# Altium schematic sheet Power-Sheet.SchDoc
size A4; SheetNumber: 2; SheetTotal: 10
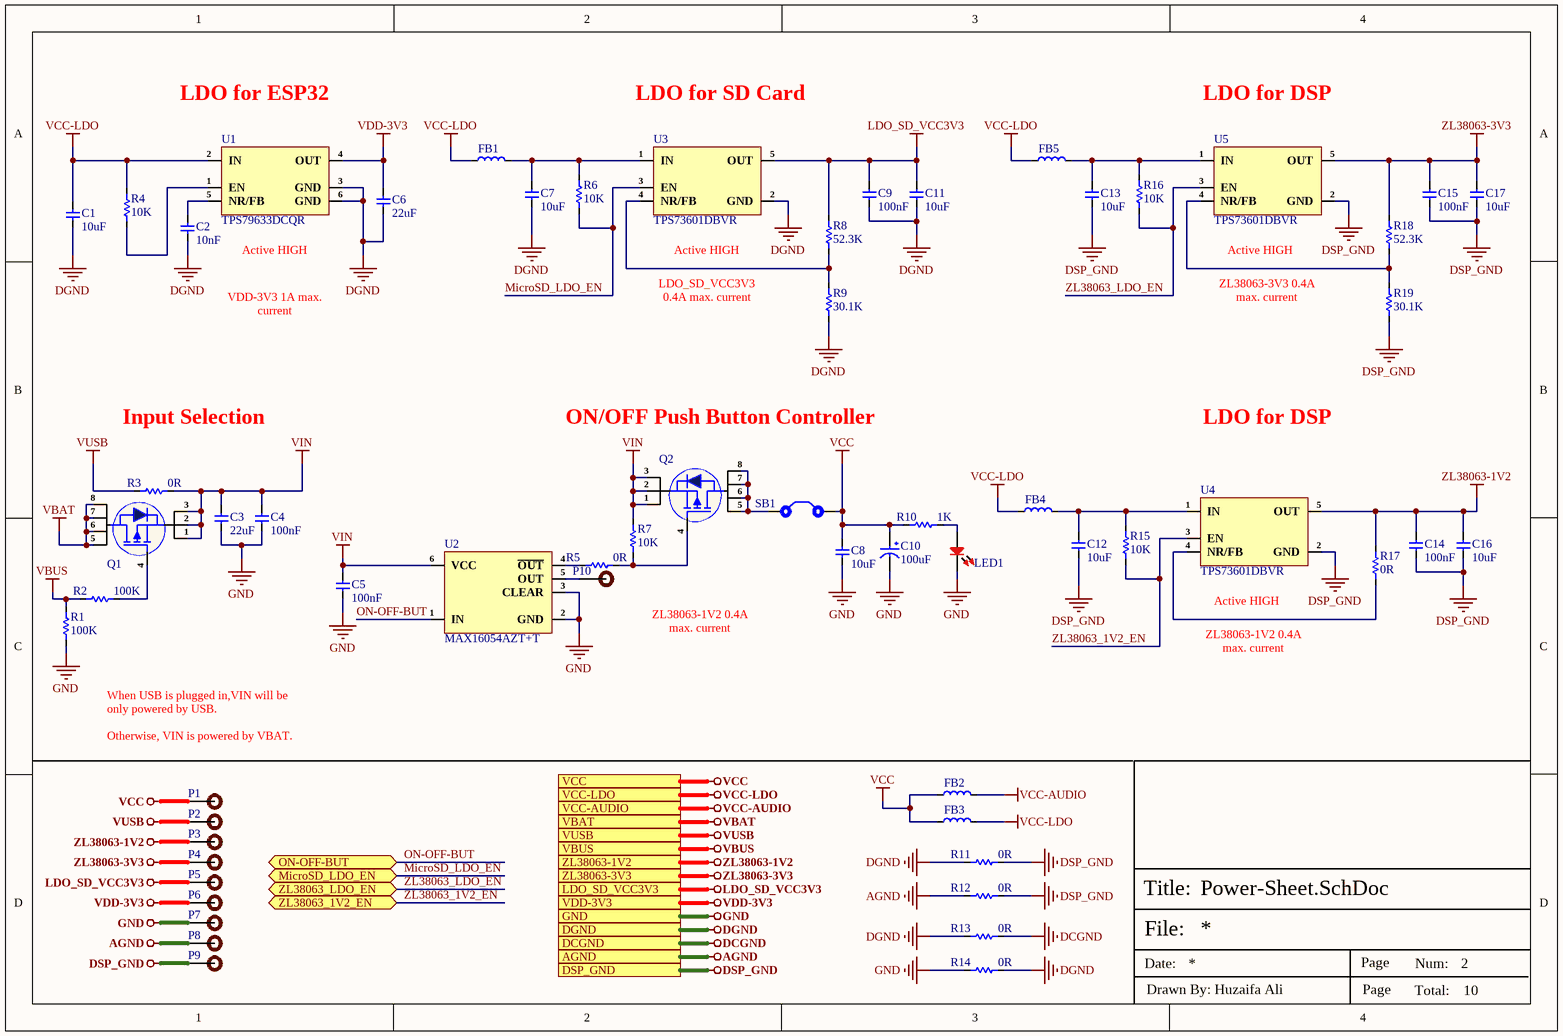
[diagram p0: Power-Sheet.SchDoc]

## Parts
C1  10uF  [Cap-0603]
C2  10nF  [Cap-0603]
C3  22uF  [Cap-0805]
C4  100nF  [Cap-0402]
C5  100nF  [Cap-0402]
C6  22uF  [Cap-0603]
C7  10uF  [Cap-0603]
C8  10uF  [Cap-0603]
C9  100nF  [Cap-0402]
C10  100uF  [Case-E]
C11  10uF  [Cap-0603]
C12  10uF  [Cap-0603]
C13  10uF  [Cap-0603]
C14  100nF  [Cap-0402]
C15  100nF  [Cap-0402]
C16  10uF  [Cap-0603]
C17  10uF  [Cap-0603]
FB1  BLM18SG121TZ1D  [IND-0603 (1608 Metric)]  (value not drawn)
FB2  BLM31KN121SZ1L  [IND-1206]  (value not drawn)
FB3  BLM18SG121TZ1D  [IND-0603 (1608 Metric)]  (value not drawn)
FB4  BLM18SG121TZ1D  [IND-0603 (1608 Metric)]  (value not drawn)
FB5  BLM18SG121TZ1D  [IND-0603 (1608 Metric)]  (value not drawn)
LED1  RED  [LED-0603]  (value not drawn)
P1  TEST POINT  [Test-point]  (value not drawn)
P2  TEST POINT  [Test-point]  (value not drawn)
P3  TEST POINT  [Test-point]  (value not drawn)
P4  TEST POINT  [Test-point]  (value not drawn)
P5  TEST POINT  [Test-point]  (value not drawn)
P6  TEST POINT  [Test-point]  (value not drawn)
P7  TEST POINT  [Test-point]  (value not drawn)
P8  TEST POINT  [Test-point]  (value not drawn)
P9  TEST POINT  [Test-point]  (value not drawn)
P10  TEST POINT  [Test-point]  (value not drawn)
Q1  IRF7410TRPBF  [SOP-8]  (value not drawn)
Q2  IRF7410TRPBF  [SOP-8]  (value not drawn)
R1  100K  [Res-0402]
R2  100K  [Res-0402]
R3  0R  [RES-2512]
R4  10K  [Res-0402]
R5  0R  [Res-0402]
R6  10K  [Res-0402]
R7  10K  [Res-0402]
R8  52.3K  [Res-0402]
R9  30.1K  [Res-0402]
R10  1K  [Res-0402]
R11  0R  [Res-0805]
R12  0R  [Res-0805]
R13  0R  [Res-0805]
R14  0R  [Res-0805]
R15  10K  [Res-0402]
R16  10K  [Res-0402]
R17  0R  [Res-0402]
R18  52.3K  [Res-0402]
R19  30.1K  [Res-0402]
SB1  Solder Bridge 0402  [Solder Bridge 0402]  (value not drawn)
U1  TPS79633DCQR  [SOT-223-6_]
U2  MAX16054AZT+T  [TSOT-23-6]
U3  TPS73601DBVR  [SOT-23-5]
U4  TPS73601DBVR  [SOT-23-5]
U5  TPS73601DBVR  [SOT-23-5]

## Ports
AGND (see Top-Sheet[1B]), DCGND (see Top-Sheet[1B]), DGND (see Top-Sheet[1A]), DSP_GND (see Top-Sheet[1B]), GND (see Top-Sheet[1A]), LDO_SD_VCC3V3 (see Top-Sheet[1B]), MicroSD_LDO_EN (bidir, see Top-Sheet[1B]), ON-OFF-BUT (bidir, see Top-Sheet[1B]), VBAT (see Top-Sheet[1A]), VBUS (see Top-Sheet[1A]), VCC (see Top-Sheet[1B]), VCC-AUDIO (see Top-Sheet[1A]), VCC-LDO (see Top-Sheet[1A]), VDD-3V3 (see Top-Sheet[1B]), VUSB (see Top-Sheet[1A]), ZL38063-1V2 (see Top-Sheet[1B]), ZL38063-3V3 (see Top-Sheet[1B]), ZL38063_1V2_EN (bidir, see Top-Sheet[1B]), ZL38063_LDO_EN (bidir, see Top-Sheet[1B])

## Nets
AGND: P8.1 R12.1 ; port AGND
DCGND: R13.2 ; port DCGND
DGND: C1.1 C2.1 C6.1 C7.1 C9.1 C11.1 R9.1 R11.1 R13.1 R14.2 U1.3(GND) U1.6(GND) U3.2(GND) ; port DGND
DSP_GND: C12.1 C13.1 C14.1 C15.1 C16.1 C17.1 P9.1 R11.2 R12.2 R19.1 U4.2(GND) U5.2(GND) ; port DSP_GND
GND: C3.1 C4.1 C5.1 C8.1 C10.2 LED1.2 P7.1 R1.1 R14.1 U2.2(GND) U2.3(CLEAR) ; port GND
LDO_SD_VCC3V3: C9.2 C11.2 P5.1 R8.2 U3.5(OUT) ; port LDO_SD_VCC3V3
VBAT: Q1.5(D) Q1.6(D) Q1.7(D) Q1.8(D) ; port VBAT
VBUS: R1.2 R2.1 ; port VBUS
VCC: C8.2 C10.1 FB2.1 FB3.1 P1.1 R10.2 SB1.2 ; port VCC
VCC-AUDIO: FB2.2 ; port VCC-AUDIO
VCC-LDO: C1.2 FB1.1 FB3.2 FB4.1 FB5.1 R4.2 U1.2(IN) ; port VCC-LDO
VDD-3V3: C6.2 P6.1 U1.4(OUT) ; port VDD-3V3
VIN: C3.2 C4.2 C5.2 Q1.1(S) Q1.2(S) Q1.3(S) Q2.1(S) Q2.2(S) Q2.3(S) R3.2 R7.2 U2.6(VCC)
VUSB: P2.1 R3.1 ; port VUSB
ZL38063-1V2: C14.2 C16.2 P3.1 R17.2 U4.5(OUT) ; port ZL38063-1V2
ZL38063-3V3: C15.2 C17.2 P4.1 R18.2 U5.5(OUT) ; port ZL38063-3V3
MicroSD_LDO_EN: R6.1 U3.3(EN) ; port MicroSD_LDO_EN
ON-OFF-BUT: U2.1(IN) ; port ON-OFF-BUT
ZL38063_1V2_EN: R15.1 U4.3(EN) ; port ZL38063_1V2_EN
ZL38063_LDO_EN: R16.1 U5.3(EN) ; port ZL38063_LDO_EN
NetC2_2: C2.2 U1.5(NR/FB)
NetC7_2: C7.2 FB1.2 R6.2 U3.1(IN)
NetC12_2: C12.2 FB4.2 R15.2 U4.1(IN)
NetC13_2: C13.2 FB5.2 R16.2 U5.1(IN)
NetLED1_1: LED1.1 R10.1
NetP10_1: P10.1 U2.5(OUT)
NetQ1_4: Q1.4(G) R2.2
NetQ2_4: Q2.4(G) R5.2 R7.1
NetQ2_5: Q2.5(D) Q2.6(D) Q2.7(D) Q2.8(D) SB1.1
NetR4_1: R4.1 U1.1(EN)
NetR5_1: R5.1 U2.4(~{OUT})
NetR8_1: R8.1 R9.2 U3.4(NR/FB)
NetR17_1: R17.1 U4.4(NR/FB)
NetR18_1: R18.1 R19.2 U5.4(NR/FB)

## Notes on the sheet
- LDO for ESP32
- LDO for SD Card
- LDO for DSP
- Active HIGH
- (near U3) Active HIGH
- (near U5) Active HIGH
- VDD-3V3 1A max. current
- LDO_SD_VCC3V3 0.4A max. current
- ZL38063-3V3 0.4A max. current
- Input Selection
- (near Q2) ON/OFF Push Button Controller
- ZL38063-1V2 0.4A max. current
- (near U4) Active HIGH
- When USB is plugged in,VIN will be only powered by USB.
  Otherwise, VIN is powered by VBAT.
- File:
- Title:
- Date:
- Page
- Num:
- Total:
- Drawn By: Huzaifa Ali

## Library data of the parts
C1 C7 C8 C11-C13 C16 C17 = CC0603KRX5R7BB106: CAP CER 10UF 16V X5R 0603; Manufacturer: Yageo; Tolerance: 10%; Item Type: Capacitor; Supplier 1: Digi-Key; Manufacturer Part Number: CC0603KRX5R7BB106; RoHS: Yes; Category: Ceramic Capacitors; Stock 1: 240725; Pricing 1: 1=0.68000, 10=0.48000, 50=0.36300, 100=0.31610, 500=0.23416, 1000=0.19903 (USD); Mount: Surface Mount; Case/Package: 0603; Case Code (Imperial): 0603; Case Code (Metric): 1608; Min Operating Temperature: -55°C; Max Operating Temperature: 85°C; Packaging: Cut Tape; Capacitance: 10uF; Voltage Rating: 16V; RoHS Compliant: Yes; ComponentLink1URL: http://www.yageo.com/documents/recent/UPY-GPHC_X5R_4V-to-50V_25.pdf?src-supplier=Digi-Key; ComponentLink1Description: http://www.yageo.com/documents/recent/UPY-GPHC_X5R_4V-to-50V_25.pdf?src-supplier=Digi-Key; Supplier Part Number 1: 311-3486-1-ND; LCSC Part Number: C2936601
C2 = CC0603JRNPO9BN103: CAP CER 10000PF 50V C0G/NPO 0603; Manufacturer: Yageo; Tolerance: 5%; Item Type: Capacitor; Supplier 1: Arrow Electronics; Manufacturer Part Number: CC0603JRNPO9BN103; RoHS: Yes; Category: Ceramic Capacitors; Stock 1: 5425; Pricing 1: 1=0.42340, 10=0.29770, 25=0.25590, 100=0.19550, 250=0.19360, 500=0.14320, 1000=0.12060, 3000=0.11930 (USD); Mount: Surface Mount; Case/Package: 0603; Min Operating Temperature: -55°C; Max Operating Temperature: 125°C; Packaging: Tape and Reel; Capacitance: 10nF; Voltage Rating: 50V; Length: 0.063inch; Width: 0.031inch; Thickness: 0.035inch; RoHS Compliant: Yes; ComponentLink1URL: http://www.yageo.com/documents/recent/UPY-GP_NP0_16V-to-50V_16.pdf?src-supplier=Digi-Key; ComponentLink1Description: http://www.yageo.com/documents/recent/UPY-GP_NP0_16V-to-50V_16.pdf?src-supplier=Digi-Key; ComponentLink2URL: http://www.yageo.com/exep/pages/download/literatures/ProductSelectionGuide%202014_Final_2.pdf?src-supplier=Digi-Key; ComponentLink2Description: http://www.yageo.com/exep/pages/download/literatures/ProductSelectionGuide%202014_Final_2.pdf?src-supplier=Digi-Key; Supplier Part Number 1: CC0603JRNPO9BN103; LCSC Part Number: C389113
C3 = CL21A226MOCLRNC: CAP CER 22UF 16V X5R 0805; Manufacturer: Samsung; Tolerance: 20%; Item Type: Capacitor; Supplier 1: Arrow Electronics; Manufacturer Part Number: CL21A226MOCLRNC; RoHS: Yes; Category: Ceramic Capacitors; Stock 1: 10030; Pricing 1: 1=0.29150, 10=0.21440, 25=0.20710, 100=0.12030, 250=0.11910, 500=0.11790, 1000=0.09220, 3000=0.07810, 6000=0.07720, 15000=0.06700 (USD); Mounting Technology: Surface Mount; Case/Package: 0805; Case Code (Metric): 2012; Case Code (Imperial): 0805; Min Operating Temperature: -55°C; Max Operating Temperature: 85°C; Packaging: Tape and Reel; Value: 22uF; Voltage Rating: 16V; Length: 0.079inch; Width: 0.049inch; Thickness: 0.037inch; RoHS Compliant: Yes; ComponentLink1URL: http://www.samsungsem.com/kr/support/product-search/mlcc/CL21A226MOCLRNC.jsp?src-supplier=Digi-Key; ComponentLink1Description: http://www.samsungsem.com/kr/support/product-search/mlcc/CL21A226MOCLRNC.jsp?src-supplier=Digi-Key; Supplier Part Number 1: CL21A226MOCLRNC; LCSC Part Number: C398815
C4 C5 C9 C14 C15 = CC0402KRX5R7BB104: CAP CER 0.1UF 16V X5R 0402; Manufacturer: Yageo; Tolerance: 10%; Supplier 1: Mouser; Manufacturer Part Number: CC0402KRX5R7BB104; RoHS: Yes; Category: Ceramic Capacitors; Stock 1: 936792; Pricing 1: 1=0.10000, 10=0.02300, 50=0.02300, 100=0.01100, 1000=0.00600, 10000=0.00400 (USD); Mount: Surface Mount; Case/Package: 0402; Number of Pins: 2; Case Code (Metric): 1005; Case Code (Imperial): 0402; Min Operating Temperature: -55°C; Max Operating Temperature: 85°C; Capacitance: 100nF; Dielectric: X5R; Packaging: Tape and Reel; Voltage Rating: 16V; Package Quantity: 1; Voltage Rating (DC): 16V; Termination: SMD/SMT; Resistor Type: Ceramic; Series: CC; Construction: Flat; Length: 1mm; Width: 0.02inch; Height: 0.5mm; Thickness: 0.022inch; Depth: 0.5mm; Radiation Hardening: No; REACH SVHC: Unknown; Lead Free: Lead Free; Halogen Free: Halogen Free; RoHS Compliant: Yes; ComponentLink1URL: https://datasheet.ciiva.com/155/mlccorderingcode-155879.pdf?src-supplier=Digi-Key; ComponentLink1Description: https://datasheet.ciiva.com/155/mlccorderingcode-155879.pdf?src-supplier=Digi-Key; ComponentLink2URL: https://datasheet.ciiva.com/155/mlccorderingcode-155878.pdf?src-supplier=Digi-Key; ComponentLink2Description: https://datasheet.ciiva.com/155/mlccorderingcode-155878.pdf?src-supplier=Digi-Key; ComponentLink3URL: https://datasheet.ciiva.com/155/mlccorderingcode-155880.pdf?src-supplier=Digi-Key; ComponentLink3Description: https://datasheet.ciiva.com/155/mlccorderingcode-155880.pdf?src-supplier=Digi-Key; ComponentLink4URL: https://datasheet.ciiva.com/11464/upy-gphc-x5r-4v-to-50v-12-11464869.pdf?src-supplier=Avnet; ComponentLink4Description: https://datasheet.ciiva.com/11464/upy-gphc-x5r-4v-to-50v-12-11464869.pdf?src-supplier=Avnet; Supplier Part Number 1: 603-CC402KRX5R7BB104; LCSC Part Number: C106204
C6 = CC0603MRX5R6BB226: CAP CER 22UF 10V X5R 0603; Manufacturer: Yageo; Tolerance: 20%; Item Type: Capacitor; Supplier 1: Digi-Key; Manufacturer Part Number: CC0603MRX5R6BB226; RoHS: Yes; Category: Ceramic Capacitors; Stock 1: 19628; Pricing 1: 1=0.68000, 10=0.48000, 50=0.36300, 100=0.31610, 500=0.23416, 1000=0.19903 (USD); Mount: Surface Mount; Case/Package: 0603; Case Code (Metric): 1608; Case Code (Imperial): 0603; Weight: 7.1E-05oz; Min Operating Temperature: -55°C; Max Operating Temperature: 85°C; Packaging: Tape and Reel; Capacitance: 22uF; Voltage Rating: 10V; Dielectric: X5R; Termination: SMD/SMT; Voltage Rating (DC): 10V; Package Quantity: 4000; Length: 0.063inch; Width: 0.8mm; Height: 0.8mm; Thickness: 0.035inch; Lead Free: Lead Free; Halogen Free: Halogen Free; RoHS Compliant: Yes; ComponentLink1URL: http://www.mouser.com/ds/2/447/Yageo_UPY-GP_NP0_16V-to-50V_9-358835.pdf?src-supplier=Mouser; ComponentLink1Description: http://www.mouser.com/ds/2/447/Yageo_UPY-GP_NP0_16V-to-50V_9-358835.pdf?src-supplier=Mouser; ComponentLink2URL: http://www.yageo.com/documents/recent/UPY-GPHC_X5R_4V-to-50V_25.pdf?src-supplier=Digi-Key; ComponentLink2Description: http://www.yageo.com/documents/recent/UPY-GPHC_X5R_4V-to-50V_25.pdf?src-supplier=Digi-Key; Supplier Part Number 1: 311-1819-1-ND; LCSC Part Number: C109447
C10 = TAJE107M025RNJ: CAP TANT 100UF 20% 25V 2917; Manufacturer: Kyocera AVX; ESR (Equivalent Series Resistance): 300mR; Leakage Current: 25uA; Polarity: Polar; Dissipation Factor: 10%; Supplier 1: Mouser; Manufacturer Part Number: TAJE107M025RNJ; RoHS: Yes; Category: Tantalum Capacitors; Stock 1: 109; Pricing 1: 1=2.81000, 10=2.81000, 50=2.81000, 100=2.19000, 1000=1.76000, 10000=1.76000 (USD); Mount: Surface Mount; Case/Package: 2917; Number of Pins: 2; Case Code (Imperial): 2917; Case Code (Metric): 7343; Min Operating Temperature: -55°C; Max Operating Temperature: 125°C; Capacitance: 100uF; Tolerance: 20%; Packaging: Tape and Reel; Voltage Rating: 25V; Voltage Rating (DC): 25V; Features: General Purpose; Package Quantity: 1; Termination: SMD/SMT; Series: TAJ; Construction: Flat; Length: 7.3mm; Width: 4.3mm; Height: 4.3mm; Depth: 4.3mm; Height - Seated (Max): 0.169inch; Radiation Hardening: No; Lead Free: Lead Free; RoHS Compliant: Yes; REACH SVHC: No SVHC; ComponentLink1URL: https://datasheet.ciiva.com/26787/taje107m025rnj-26787048.pdf?src-supplier=IIIC; ComponentLink1Description: https://datasheet.ciiva.com/26787/taje107m025rnj-26787048.pdf?src-supplier=IIIC; ComponentLink2URL: https://datasheet.ciiva.com/265/taj-265541.pdf?src-supplier=Digi-Key; ComponentLink2Description: https://datasheet.ciiva.com/265/taj-265541.pdf?src-supplier=Digi-Key; ComponentLink3URL: https://datasheet.ciiva.com/265/taj-265542.pdf?src-supplier=Digi-Key; ComponentLink3Description: https://datasheet.ciiva.com/265/taj-265542.pdf?src-supplier=Digi-Key; ComponentLink4URL: https://datasheet.ciiva.com/265/taj-265540.pdf?src-supplier=Digi-Key; ComponentLink4Description: https://datasheet.ciiva.com/265/taj-265540.pdf?src-supplier=Digi-Key; ComponentLink5URL: https://datasheet.ciiva.com/28609/1719052-28609254.pdf?src-supplier=Element14; ComponentLink5Description: https://datasheet.ciiva.com/28609/1719052-28609254.pdf?src-supplier=Element14; ComponentLink6URL: https://datasheet.ciiva.com/11230/taj-11230456.pdf?src-supplier=Avnet; ComponentLink6Description: https://datasheet.ciiva.com/11230/taj-11230456.pdf?src-supplier=Avnet; ComponentLink7URL: https://datasheet.ciiva.com/17339/taj-17339677.pdf?src-supplier=Avnet+Europe; ComponentLink7Description: https://datasheet.ciiva.com/17339/taj-17339677.pdf?src-supplier=Avnet+Europe; ComponentLink8URL: https://datasheet.ciiva.com/22667/1719052-22667581.pdf?src-supplier=Element14; ComponentLink8Description: https://datasheet.ciiva.com/22667/1719052-22667581.pdf?src-supplier=Element14; Supplier Part Number 1: 581-TAJE107M025RNJ; LCSC Part Number: C7230
FB1 FB3-FB5 = BLM18SG121TZ1D: FERRITE BEAD 120 OHM 0603 1LN; Manufacturer: Murata; Core Material: 228ConductorMaterial; Value: 25mR; RMS Current (Irms): 3A; Test Frequency: 100MHz; Tolerance: 25%; Supplier: Rs; Supplier Part Number: 2234927P; Manufacturer Part Number: BLM18SG121TZ1D; RoHS: Yes; Category: Ferrite Beads and Chips; Stock: 19700; Pricing: 500=0.033, 1000=0.028, 2000=0.026, 5000=0.024 (GBP); ESR: 25mR; Height: 650um; ComponentLink1URL: https://datasheet.octopart.com/BLM18SG121TZ1D-Murata-datasheet-101965366.pdf?src-supplier=Future+Electronics; ComponentLink1Description: https://datasheet.octopart.com/BLM18SG121TZ1D-Murata-datasheet-101965366.pdf?src-supplier=Future+Electronics; ComponentLink2URL: https://www.murata.com/en-us/products/productdata/8796750610462/QNFA9122.pdf?src-supplier=Digi-Key; ComponentLink2Description: https://www.murata.com/en-us/products/productdata/8796750610462/QNFA9122.pdf?src-supplier=Digi-Key; LCSC Part Number: C710390; Item Type: Ferrite Bead
FB2 = BLM31KN121SZ1L: FERRITE BEAD 120 OHM 1206 1LN; Manufacturer: Murata; Core Material: 228ConductorMaterial; Number of Lines: 1; Max Current Rating: 6A; Value: 9mR; Test Frequency: 100MHz; Tolerance: 25%; Supplier: Arrow Electronics; Supplier Part Number: BLM31KN121SZ1L; Manufacturer Part Number: BLM31KN121SZ1L; RoHS: Yes; Category: Ferrite Beads and Chips; Stock: 1640; Pricing: 1=0.2889, 10=0.1979, 25=0.1782, 100=0.1604, 250=0.1402, 500=0.1315, 1000=0.108, 3000=0.1008, 6000=0.0945 (USD); Mounting Technology: Surface Mount; Case/Package: 1206; Case Code (Imperial): 1206; Case Code (Metric): 3216; Min Operating Temperature: -55°C; Max Operating Temperature: 125°C; Packaging: Cut Tape; Series: BLM; RMS Current (Irms): 6A; ESR: 9mR; Height: 1.8mm; Ratings: AEC-Q200; RoHS Compliant: Yes; ComponentLink1URL: https://www.murata.com/en-global/products/productdata/8796751200286/QNFA9115.pdf?src-supplier=Digi-Key; ComponentLink1Description: https://www.murata.com/en-global/products/productdata/8796751200286/QNFA9115.pdf?src-supplier=Digi-Key; LCSC Part Number: C710516; Item Type: Ferrite Bead
LED1 = NCD0603R3: RED LED 0603 Light Emitting Diodes; Manufacturer: Foshan NationStar Optoelectronics; Manufacturer Part Number: NCD0603R3; Package: 0603; Item Type: LED; LCSC Part Number: C3151730; ComponentLink1Description: LCSC; ComponentLink1URL: https://www.lcsc.com/product-detail/Light-Emitting-Diodes-LED_Foshan-NationStar-Optoelectronics-NCD0603R3_C3151730.html
P1-P10 = TEST POINT: Test Point ON; Item Type: TEST POINT
Q1 Q2 = IRF7410TRPBF: MOSFET P-CH 12V 16A 8SO; Manufacturer: Infineon; Supplier: Mouser; Supplier Part Number: 942-IRF7410TRPBF; Manufacturer Part Number: IRF7410TRPBF; RoHS: Yes; Category: MOSFETs; Stock: 296; Pricing: 1=1.13, 10=0.922, 50=0.922, 100=0.716, 1000=0.487, 10000=0.437 (USD); ComponentLink1URL: http://datasheet.octopart.com/IRF7410TRPBF-Infineon-datasheet-8080302.pdf?src-supplier=TME; ComponentLink1Description: http://datasheet.octopart.com/IRF7410TRPBF-Infineon-datasheet-8080302.pdf?src-supplier=TME; LCSC Part Number: C148144; Item Type: MOSFET
R1 R2 = RC0402FR-07100KL: RES 100K OHM 1% 1/16W 0402; Manufacturer: Yageo; Resistance: 100kR; Temperature Coefficient: 100ppm/°C; Power Rating: 63mW; Voltage Rating: 50V; Item Type: Resistor; Supplier 1: Mouser; Manufacturer Part Number: RC0402FR-07100KL; RoHS: Yes; Category: Chip SMD Resistors; Stock 1: 7759549; Pricing 1: 1=0.10000, 10=0.01200, 50=0.01200, 100=0.00500, 1000=0.00300, 2500=0.00200, 10000=0.00100 (USD); Case/Package: 0402; Case Code (Metric): 1005; Case Code (Imperial): 0402; Min Operating Temperature: -55°C; Max Operating Temperature: 155°C; Resistor Type: Thick Film; Tolerance: 1%; Packaging: Tape and Reel; Package Quantity: 1; Number of Terminations: 2; Termination: SMD/SMT; Max Power Dissipation: 63mW; Working Voltage: 50V; Features: Moisture Resistant; Series: RC; Resistance Tolerance: 1%; Construction: Rectangular; Technology: THICK FILM; Length: 0.039inch; Width: 0.02inch; Height: 0.016inch; Depth: 0.5mm; REACH SVHC: No SVHC; Lead Free: Lead Free; RoHS Compliant: Yes; Military Standard: Not; ComponentLink1URL: https://datasheet.ciiva.com/11819/0900766b80c66297-11819452.pdf?src-supplier=RSComponents; ComponentLink1Description: https://datasheet.ciiva.com/11819/0900766b80c66297-11819452.pdf?src-supplier=RSComponents; ComponentLink2URL: https://datasheet.ciiva.com/22747/1018594-22747509.pdf?src-supplier=Element14; ComponentLink2Description: https://datasheet.ciiva.com/22747/1018594-22747509.pdf?src-supplier=Element14; ComponentLink3URL: https://datasheet.ciiva.com/2453/pyu-r-int-thick-7-2453362.pdf?src-supplier=Digi-Key; ComponentLink3Description: https://datasheet.ciiva.com/2453/pyu-r-int-thick-7-2453362.pdf?src-supplier=Digi-Key; ComponentLink4URL: https://datasheet.ciiva.com/2453/pyu-r-int-thick-7-2453363.pdf?src-supplier=Digi-Key; ComponentLink4Description: https://datasheet.ciiva.com/2453/pyu-r-int-thick-7-2453363.pdf?src-supplier=Digi-Key; ComponentLink5URL: https://datasheet.ciiva.com/2453/pyu-r-int-thick-7-2453361.pdf?src-supplier=Digi-Key; ComponentLink5Description: https://datasheet.ciiva.com/2453/pyu-r-int-thick-7-2453361.pdf?src-supplier=Digi-Key; ComponentLink6URL: https://datasheet.ciiva.com/12667/pyu-rc0402-51-rohs-l-6-r-12667930.pdf?src-supplier=Mouser; ComponentLink6Description: https://datasheet.ciiva.com/12667/pyu-rc0402-51-rohs-l-6-r-12667930.pdf?src-supplier=Mouser; ComponentLink7URL: https://datasheet.ciiva.com/15189/getdatasheetpartid-323696-15189334.pdf?src-supplier=Verical; ComponentLink7Description: https://datasheet.ciiva.com/15189/getdatasheetpartid-323696-15189334.pdf?src-supplier=Verical; Supplier Part Number 1: 603-RC0402FR-07100KL; LCSC Part Number: C60491
R3 = FRP2512F0000TS: 2W Thick Film Resistors ±200ppm/℃ ±1% 0Ω 2512 Chip Resistor - Surface Mount ROHS; Manufacturer: FOJAN; Manufacturer Part Number: FRP2512F0000TS; Package: 2512; LCSC Part Number: C5204052; Item Type: Resistor; ComponentLink1Description: LCSC; ComponentLink1URL: https://www.lcsc.com/product-detail/Chip-Resistor-Surface-Mount_FOJAN-FRP2512F0000TS_C5204052.html
R4 R6 R7 R15 R16 = RC0402FR-0710KL: RES 10K OHM 1% 1/16W 0402; Manufacturer: Yageo; Resistance: 10kR; Voltage Rating (DC): 50V; Temperature Coefficient: 100ppm/°C; Power Rating: 62.5mW; Max Power Dissipation: 63mW; Item Type: Resistor; Supplier 1: Mouser; Manufacturer Part Number: RC0402FR-0710KL; RoHS: Yes; Category: Chip SMD Resistors; Stock 1: 18648329; Pricing 1: 1=0.10000, 10=0.01400, 50=0.01400, 100=0.00500, 1000=0.00300, 10000=0.00200 (USD); Case/Package: 0402; Number of Pins: 2; Case Code (Imperial): 0402; Case Code (Metric): 1005; Min Operating Temperature: -55°C; Max Operating Temperature: 155°C; Resistor Type: Thick Film; Tolerance: 1%; Packaging: Tape and Reel; Voltage Rating: 50V; Termination: SMD/SMT; Working Voltage: 50V; Number of Terminations: 2; Features: Moisture Resistant; Series: RC; Resistance Tolerance: 1%; Construction: Rectangular; Length: 1mm; Width: 0.5mm; Height: 0.32mm; Depth: 0.5mm; Lead Pitch: 0.2mm; REACH SVHC: No SVHC; Lead Free: Lead Free; RoHS Compliant: Yes; Military Standard: Not; ComponentLink1URL: https://datasheet.ciiva.com/7660/38568-7660787.pdf?src-supplier=Element14; ComponentLink1Description: https://datasheet.ciiva.com/7660/38568-7660787.pdf?src-supplier=Element14; ComponentLink2URL: https://datasheet.ciiva.com/7849/1686128-7849814.pdf?src-supplier=Element14; ComponentLink2Description: https://datasheet.ciiva.com/7849/1686128-7849814.pdf?src-supplier=Element14; ComponentLink3URL: https://datasheet.ciiva.com/7983/1018594-7983486.pdf?src-supplier=Element14; ComponentLink3Description: https://datasheet.ciiva.com/7983/1018594-7983486.pdf?src-supplier=Element14; ComponentLink4URL: https://datasheet.ciiva.com/22747/1018594-22747512.pdf?src-supplier=Element14; ComponentLink4Description: https://datasheet.ciiva.com/22747/1018594-22747512.pdf?src-supplier=Element14; ComponentLink5URL: https://datasheet.ciiva.com/12667/pyu-rc0402-51-rohs-l-6-r-12667067.pdf?src-supplier=Mouser; ComponentLink5Description: https://datasheet.ciiva.com/12667/pyu-rc0402-51-rohs-l-6-r-12667067.pdf?src-supplier=Mouser; ComponentLink6URL: https://datasheet.ciiva.com/7849/1784430-7849813.pdf?src-supplier=Element14; ComponentLink6Description: https://datasheet.ciiva.com/7849/1784430-7849813.pdf?src-supplier=Element14; ComponentLink7URL: https://datasheet.ciiva.com/7849/1784430-7849815.pdf?src-supplier=Element14; ComponentLink7Description: https://datasheet.ciiva.com/7849/1784430-7849815.pdf?src-supplier=Element14; Supplier Part Number 1: 603-RC0402FR-0710KL; LCSC Part Number: C60490
R5 R17 = RC0402FR-070RL: RES 0 OHM JUMPER 1/16W 0402; Manufacturer: Yageo; Tolerance: 1%; Power Rating: 62.5mW; Voltage Rating: 50V; Temperature Coefficient: 200ppm/°C; Max Power Dissipation: 63mW; Supplier 1: Mouser; Manufacturer Part Number: RC0402FR-070RL; RoHS: Yes; Category: Chip SMD Resistors; Stock 1: 8556842; Pricing 1: 1=0.10000, 10=0.01400, 50=0.01400, 100=0.00600, 1000=0.00300, 5000=0.00200, 10000=0.00100 (USD); Mount: Surface Mount; Case/Package: 0402; Contact Plating: Tin,Matte; Case Code (Imperial): 0402; Case Code (Metric): 1005; Size Code: 0402; Min Operating Temperature: -55°C; Max Operating Temperature: 155°C; Resistance: 0R; Resistor Type: Thick Film; Packaging: Tape and Reel; Termination: SMD/SMT; Features: Moisture Resistant; Series: RC; Number of Terminations: 2; Length: 1mm; Width: 0.5mm; Height: 0.35mm; Radiation Hardening: No; Lead Free: Lead Free; RoHS Compliant: Yes; ComponentLink1URL: https://datasheet.ciiva.com/8896/pyu-rc0402-51-rohs-l-6-8896149.pdf?src-supplier=Avnet; ComponentLink1Description: https://datasheet.ciiva.com/8896/pyu-rc0402-51-rohs-l-6-8896149.pdf?src-supplier=Avnet; ComponentLink2URL: https://datasheet.ciiva.com/16790/pyu-rc0402-51-rohs-l-6-r-16790444.pdf?src-supplier=Future+Electronics; ComponentLink2Description: https://datasheet.ciiva.com/16790/pyu-rc0402-51-rohs-l-6-r-16790444.pdf?src-supplier=Future+Electronics; Supplier Part Number 1: 603-RC0402FR-070RL; LCSC Part Number: C106231
R8 R18 = RT0402BRD0752K3L: RES SMD 52.3KOHM 0.1% 1/16W 0402; Manufacturer: Yageo; Item Type: Resistor; Supplier: Future Electronics; Supplier Part Number: 8123886; Manufacturer Part Number: RT0402BRD0752K3L; RoHS: Yes; Category: Chip SMD Resistors; Stock: 30000; Pricing: 10000=0.0218, 20000=0.0213, 30000=0.021, 50000=0.0206, 100000=0.0199 (USD); ComponentLink1URL: https://datasheet.ciiva.com/2582/pyu-rt-1-to-0-05-rohs-l-4-2582419.pdf?src-supplier=Digi-Key; ComponentLink1Description: https://datasheet.ciiva.com/2582/pyu-rt-1-to-0-05-rohs-l-4-2582419.pdf?src-supplier=Digi-Key; ComponentLink2URL: https://datasheet.ciiva.com/12798/pyu-rt-1-to-0-05-rohs-l-4-12798955.pdf?src-supplier=Mouser; ComponentLink2Description: https://datasheet.ciiva.com/12798/pyu-rt-1-to-0-05-rohs-l-4-12798955.pdf?src-supplier=Mouser; LCSC Part Number: C852832
R9 R19 = RT0402BRD0730K1L: RES SMD 30.1KOHM 0.1% 1/16W 0402; Manufacturer: Yageo; Item Type: Resistor; Supplier: Rs; Supplier Part Number: 1991324P; Manufacturer Part Number: RT0402BRD0730K1L; RoHS: Yes; Category: Chip SMD Resistors; Stock: 7420; Pricing: 100=0.138, 250=0.115, 500=0.092, 1000=0.076 (GBP); ComponentLink1URL: https://datasheet.ciiva.com/12722/pyu-rt-1-to-0-05-rohs-l-4-12722119.pdf?src-supplier=Mouser; ComponentLink1Description: https://datasheet.ciiva.com/12722/pyu-rt-1-to-0-05-rohs-l-4-12722119.pdf?src-supplier=Mouser; ComponentLink2URL: https://datasheet.ciiva.com/2582/pyu-rt-1-to-0-05-rohs-l-5-2582303.pdf?src-supplier=Digi-Key; ComponentLink2Description: https://datasheet.ciiva.com/2582/pyu-rt-1-to-0-05-rohs-l-5-2582303.pdf?src-supplier=Digi-Key; LCSC Part Number: C852714
R10 = RC0402FR-071KL: RES 1K OHM 1% 1/16W 0402; Manufacturer: Yageo; Resistance: 1kR; Temperature Coefficient: 100ppm/°C; Voltage Rating (DC): 50V; Power Rating: 62.5mW; Max Power Dissipation: 63mW; Item Type: Resistor; Supplier 1: Avnet; Manufacturer Part Number: RC0402FR-071KL; RoHS: Yes; Category: Chip SMD Resistors; Stock 1: 13030000; Pricing 1: 10000=0.00085, 20000=0.00087, 40000=0.00084, 60000=0.00083, 80000=0.00079, 100000=0.00078, 1000000=0.00076 (USD); Case/Package: 0402; Number of Pins: 2; Case Code (Imperial): 0402; Case Code (Metric): 1005; Size Code: 0402; Min Operating Temperature: -55°C; Max Operating Temperature: 155°C; Resistor Type: Thick Film; Tolerance: 1%; Packaging: Tape and Reel; Voltage Rating: 50V; Termination: SMD/SMT; Features: Moisture Resistant; Series: RC; Number of Terminations: 2; Resistance Tolerance: 1%; Construction: Rectangular; Technology: THICK FILM; Length: 1mm; Width: 0.5mm; Height: 0.32mm; Depth: 0.5mm; Reach SVHC Compliant: Yes; Lead Free: Lead Free; RoHS Compliant: Yes; Military Standard: Not; ComponentLink1URL: https://datasheet.ciiva.com/11819/0900766b80c66297-11819477.pdf?src-supplier=RSComponents; ComponentLink1Description: https://datasheet.ciiva.com/11819/0900766b80c66297-11819477.pdf?src-supplier=RSComponents; ComponentLink2URL: https://datasheet.ciiva.com/7983/1018594-7983502.pdf?src-supplier=Element14; ComponentLink2Description: https://datasheet.ciiva.com/7983/1018594-7983502.pdf?src-supplier=Element14; ComponentLink3URL: https://datasheet.ciiva.com/22747/1018594-22747513.pdf?src-supplier=Element14; ComponentLink3Description: https://datasheet.ciiva.com/22747/1018594-22747513.pdf?src-supplier=Element14; ComponentLink4URL: https://datasheet.ciiva.com/12666/pyu-rc0402-51-rohs-l-6-r-12666741.pdf?src-supplier=Mouser; ComponentLink4Description: https://datasheet.ciiva.com/12666/pyu-rc0402-51-rohs-l-6-r-12666741.pdf?src-supplier=Mouser; ComponentLink5URL: https://datasheet.ciiva.com/7849/1018594-7849869.pdf?src-supplier=Element14; ComponentLink5Description: https://datasheet.ciiva.com/7849/1018594-7849869.pdf?src-supplier=Element14; ComponentLink6URL: https://datasheet.ciiva.com/7849/1018594-7849871.pdf?src-supplier=Element14; ComponentLink6Description: https://datasheet.ciiva.com/7849/1018594-7849871.pdf?src-supplier=Element14; ComponentLink7URL: https://datasheet.ciiva.com/17063/pyu-rc0402-51-rohs-l-6-r-17063193.pdf?src-supplier=Future+Electronics; ComponentLink7Description: https://datasheet.ciiva.com/17063/pyu-rc0402-51-rohs-l-6-r-17063193.pdf?src-supplier=Future+Electronics; Supplier Part Number 1: RC0402FR-071KL; LCSC Part Number: C106235
R11-R14 = RC0805FR-070RL: RES 0 OHM JUMPER 1/8W 0805; Manufacturer: Yageo; Resistance: 0mR; Tolerance: 1%; Power Rating: 125mW; Item Type: Resistor; Supplier 1: Avnet; Manufacturer Part Number: RC0805FR-070RL; RoHS: Yes; Category: Chip SMD Resistors; Stock 1: 85000; Pricing 1: 5000=0.00281, 10000=0.00277, 20000=0.00269 (USD); Case/Package: 0805; Contact Plating: Tin,Matte; Case Code (Imperial): 0805; Case Code (Metric): 2012; Size Code: 0805; Min Operating Temperature: -55°C; Max Operating Temperature: 155°C; Resistor Type: Thick Film; Packaging: Tape and Reel; Features: Moisture Resistant; Series: RC; Max Power Dissipation: 125mW; Number of Terminations: 2; Construction: Rectangular; Length: 2mm; Depth: 1.25mm; Radiation Hardening: No; Military Standard: Not; Lead Free: Lead Free; RoHS Compliant: Yes; ComponentLink1URL: https://datasheet.ciiva.com/15189/getdatasheetpartid-348154-15189885.pdf?src-supplier=Verical; ComponentLink1Description: https://datasheet.ciiva.com/15189/getdatasheetpartid-348154-15189885.pdf?src-supplier=Verical; ComponentLink2URL: https://datasheet.ciiva.com/17042/rc0805-17042698.pdf?src-supplier=Future+Electronics; ComponentLink2Description: https://datasheet.ciiva.com/17042/rc0805-17042698.pdf?src-supplier=Future+Electronics; Supplier Part Number 1: RC0805FR-070RL; LCSC Part Number: C100045
SB1 = Solder Bridge 0402: Solder Bridge ON; Manufacturer Part Number: Solder Bridge 0402; Item Type: Solder Bridge
U1 = TPS79633DCQR: IC REG LINEAR 3.3V 1A SOT223-6; Manufacturer: Texas Instruments; Supplier: Mouser; Supplier Part Number: 595-TPS79633DCQR; Manufacturer Part Number: TPS79633DCQR; RoHS: Yes; Category: Voltage Regulators - Linear; Stock: 3089; Pricing: 1=3.24, 10=2.75, 50=2.75, 100=2.39, 1000=1.72, 10000=1.56 (USD); Length: 6.5mm; Width: 3.5mm; Thickness: 1.6mm; ComponentLink1URL: https://datasheet.ciiva.com/2045/tps79601-2045264.pdf?src-supplier=Digi-Key; ComponentLink1Description: https://datasheet.ciiva.com/2045/tps79601-2045264.pdf?src-supplier=Digi-Key; ComponentLink2URL: https://datasheet.ciiva.com/22704/1846966-22704703.pdf?src-supplier=Element14; ComponentLink2Description: https://datasheet.ciiva.com/22704/1846966-22704703.pdf?src-supplier=Element14; ComponentLink3URL: https://datasheet.ciiva.com/41462/001015136-da-01-en-ic-reg-ldo-3-3v-1-tps79633dcqr-sot-6-tid-41462982.pdf?src-supplier=Conrad; ComponentLink3Description: https://datasheet.ciiva.com/41462/001015136-da-01-en-ic-reg-ldo-3-3v-1-tps79633dcqr-sot-6-tid-41462982.pdf?src-supplier=Conrad; LCSC Part Number: C485803; Item Type: IC
U2 = MAX16054AZT+T: IC CNTRLR ON/OFF W/DEB TSOT23-6; Manufacturer: Maxim; Max Power Dissipation: 727W; Max Supply Voltage: 5.5V; Min Supply Voltage: 2.7V; Number of Voltages Monitored: 1; Undervoltage Threshold: 1.8V; Operating Supply Current: 7uA; Watchdog Timer: No; Output Type: PUSH-PULL; Supplier 1: Arrow Electronics; Manufacturer Part Number: MAX16054AZT+T; RoHS: Yes; Category: Interface ICs; Stock 1: 3; Pricing 1: 1=2.99700 (USD); Mounting Technology: Surface Mount; Case/Package: SOT-23-6; Pins: 6; Contact Plating: Tin,Matte; Min Operating Temperature: -40°C; Max Operating Temperature: 125°C; Packaging: Tape and Reel; Package Quantity: 1; Series: -; Length: 4mm; Width: 4mm; Height: 0.73mm; Radiation Hardening: No; RoHS Compliant: Yes; ComponentLink1URL: https://datasheet.ciiva.com/4901/max16054-83881-4901086.pdf?src-supplier=Mouser; ComponentLink1Description: https://datasheet.ciiva.com/4901/max16054-83881-4901086.pdf?src-supplier=Mouser; ComponentLink2URL: https://datasheet.ciiva.com/1784/max16054-1784560.pdf?src-supplier=Digi-Key; ComponentLink2Description: https://datasheet.ciiva.com/1784/max16054-1784560.pdf?src-supplier=Digi-Key; ComponentLink3URL: https://datasheet.ciiva.com/14247/max16054-14247770.pdf?src-supplier=Avnet; ComponentLink3Description: https://datasheet.ciiva.com/14247/max16054-14247770.pdf?src-supplier=Avnet; ComponentLink4URL: https://datasheet.ciiva.com/1784/max16054-1784561.pdf?src-supplier=Digi-Key; ComponentLink4Description: https://datasheet.ciiva.com/1784/max16054-1784561.pdf?src-supplier=Digi-Key; ComponentLink5URL: https://datasheet.ciiva.com/1784/max16054-1784562.pdf?src-supplier=Digi-Key; ComponentLink5Description: https://datasheet.ciiva.com/1784/max16054-1784562.pdf?src-supplier=Digi-Key; Supplier Part Number 1: MAX16054AZT+T; LCSC Part Number: C79401; Item Type: IC
U3-U5 = TPS73601DBVR: IC REG LIN POS ADJ 400MA SOT23-5; Manufacturer: Texas Instruments; Supplier: Mouser; Supplier Part Number: 595-TPS73601DBVR; Manufacturer Part Number: TPS73601DBVR; RoHS: Yes; Category: Voltage Regulators - Linear; Stock: 2988; Pricing: 1=1.44, 10=1.25, 50=1.25, 100=0.966, 1000=0.655, 10000=0.621 (USD); ComponentLink1URL: https://datasheet.ciiva.com/22700/1831172-22700145.pdf?src-supplier=Element14; ComponentLink1Description: https://datasheet.ciiva.com/22700/1831172-22700145.pdf?src-supplier=Element14; ComponentLink2URL: https://datasheet.ciiva.com/41462/001015018-da-01-en-ic-reg-ldo-adj-0-tps73601dbvr-sot-5-tid-41462863.pdf?src-supplier=Conrad; ComponentLink2Description: https://datasheet.ciiva.com/41462/001015018-da-01-en-ic-reg-ldo-adj-0-tps73601dbvr-sot-5-tid-41462863.pdf?src-supplier=Conrad; LCSC Part Number: C59200; Item Type: IC